# Altium schematic sheet Mux_Sheet_2.SchDoc
size A4; SheetNumber: 9
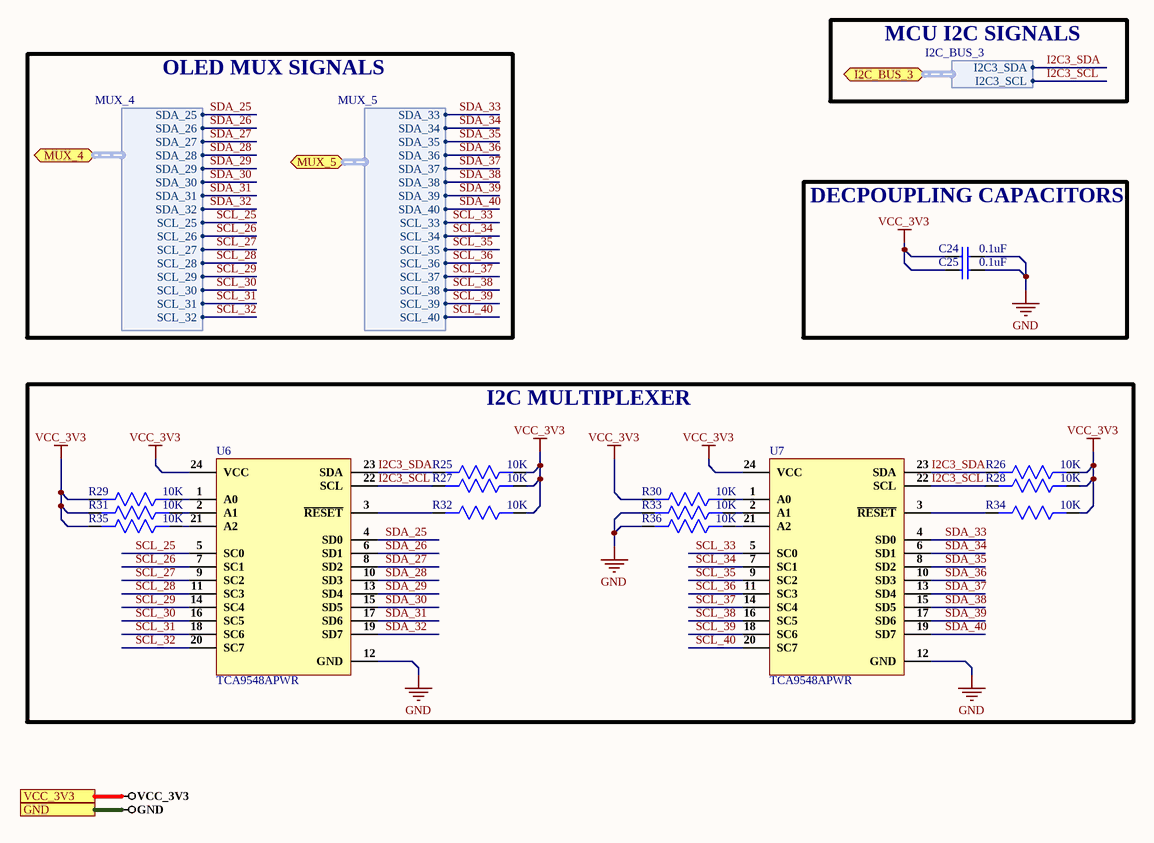
[diagram p0: Mux_Sheet_2.SchDoc]

## Parts
C24  0.1uF  [Cap0603]
C25  0.1uF  [Cap0603]
R25  10K  [Res0603]
R26  10K  [Res0603]
R27  10K  [Res0603]
R28  10K  [Res0603]
R29  10K  [Res0603]
R30  10K  [Res0603]
R31  10K  [Res0603]
R32  10K  [Res0603]
R33  10K  [Res0603]
R34  10K  [Res0603]
R35  10K  [Res0603]
R36  10K  [Res0603]
U6  TCA9548APWR  [24-TSSOP]
U7  TCA9548APWR  [24-TSSOP]

## Blocks framed on the sheet
DECPOUPLING CAPACITORS: C24 C25
I2C MULTIPLEXER: R25-R36 U6 U7

## Ports
GND, I2C_BUS_3 (bidir, harness I2C_BUS_3), MUX_4 (bidir, harness MUX_4), MUX_5 (bidir, harness MUX_5), VCC_3V3

## Harnesses
MUX_4: SDA_25, SDA_26, SDA_27, SDA_28, SDA_29, SDA_30, SDA_31, SDA_32, SCL_25, SCL_26, SCL_27, SCL_28, SCL_29, SCL_30, SCL_31, SCL_32
MUX_5: SDA_33, SDA_34, SDA_35, SDA_36, SDA_37, SDA_38, SDA_39, SDA_40, SCL_33, SCL_34, SCL_35, SCL_36, SCL_37, SCL_38, SCL_39, SCL_40
I2C_BUS_3: I2C3_SDA, I2C3_SCL

## Nets
GND: C24.2 C25.2 R33.2 R36.2 U6.12(GND) U7.12(GND) ; port GND
VCC_3V3: C24.1 C25.1 R25.1 R26.1 R27.1 R28.1 R29.2 R30.2 R31.2 R32.1 R34.1 R35.2 U6.24(VCC) U7.24(VCC) ; port VCC_3V3
I2C3_SCL: R27.2 R28.2 U6.22(SCL) U7.22(SCL) ; port I2C_BUS_3.I2C3_SCL
I2C3_SDA: R25.2 R26.2 U6.23(SDA) U7.23(SDA) ; port I2C_BUS_3.I2C3_SDA
SCL_25: U6.5(SC0) ; port MUX_4.SCL_25
SCL_26: U6.7(SC1) ; port MUX_4.SCL_26
SCL_27: U6.9(SC2) ; port MUX_4.SCL_27
SCL_28: U6.11(SC3) ; port MUX_4.SCL_28
SCL_29: U6.14(SC4) ; port MUX_4.SCL_29
SCL_30: U6.16(SC5) ; port MUX_4.SCL_30
SCL_31: U6.18(SC6) ; port MUX_4.SCL_31
SCL_32: U6.20(SC7) ; port MUX_4.SCL_32
SCL_33: U7.5(SC0) ; port MUX_5.SCL_33
SCL_34: U7.7(SC1) ; port MUX_5.SCL_34
SCL_35: U7.9(SC2) ; port MUX_5.SCL_35
SCL_36: U7.11(SC3) ; port MUX_5.SCL_36
SCL_37: U7.14(SC4) ; port MUX_5.SCL_37
SCL_38: U7.16(SC5) ; port MUX_5.SCL_38
SCL_39: U7.18(SC6) ; port MUX_5.SCL_39
SCL_40: U7.20(SC7) ; port MUX_5.SCL_40
SDA_25: U6.4(SD0) ; port MUX_4.SDA_25
SDA_26: U6.6(SD1) ; port MUX_4.SDA_26
SDA_27: U6.8(SD2) ; port MUX_4.SDA_27
SDA_28: U6.10(SD3) ; port MUX_4.SDA_28
SDA_29: U6.13(SD4) ; port MUX_4.SDA_29
SDA_30: U6.15(SD5) ; port MUX_4.SDA_30
SDA_31: U6.17(SD6) ; port MUX_4.SDA_31
SDA_32: U6.19(SD7) ; port MUX_4.SDA_32
SDA_33: U7.4(SD0) ; port MUX_5.SDA_33
SDA_34: U7.6(SD1) ; port MUX_5.SDA_34
SDA_35: U7.8(SD2) ; port MUX_5.SDA_35
SDA_36: U7.10(SD3) ; port MUX_5.SDA_36
SDA_37: U7.13(SD4) ; port MUX_5.SDA_37
SDA_38: U7.15(SD5) ; port MUX_5.SDA_38
SDA_39: U7.17(SD6) ; port MUX_5.SDA_39
SDA_40: U7.19(SD7) ; port MUX_5.SDA_40
NetR29_1: R29.1 U6.1(A0)
NetR30_1: R30.1 U7.1(A0)
NetR31_1: R31.1 U6.2(A1)
NetR32_2: R32.2 U6.3(~{RESET})
NetR33_1: R33.1 U7.2(A1)
NetR34_2: R34.2 U7.3(~{RESET})
NetR35_1: R35.1 U6.21(A2)
NetR36_1: R36.1 U7.21(A2)

## Notes on the sheet
- MCU I2C SIGNALS
- OLED MUX SIGNALS

## Library data of the parts
C24 C25 = CC0603ZRY5V9BB104: CAP CER 0.1UF 50V Y5V 0603; Manufacturer: Yageo; Capacitance: 100nF; Tolerance: 80%; Supplier 1: Digi-Key; Manufacturer Part Number: CC0603ZRY5V9BB104; Stock 1: 15000880; Pricing 1: 1=0.1, 10=0.075, 100=0.0334, 500=0.02386, 1000=0.01874 (USD); Mount: Surface Mount; Case/Package: 0603; Number of Pins: 2; Case Code (Metric): 1608; Case Code (Imperial): 0603; Min Operating Temperature: -30°C; Max Operating Temperature: 85°C; Dielectric: Y5V; Voltage Rating: 50V; Package Quantity: 1; Packaging: Tape and Reel; Voltage Rating (DC): 50V; Termination: SMD/SMT; Composition: Ceramic; Voltage: 50V; Length: 1.6mm; Height: 0.8mm; Width: 0.031inch; Thickness: 0.035inch; Depth: 0.8mm; Radiation Hardening: No; REACH SVHC: No SVHC; Lead Free: Lead Free; Halogen Free: Halogen Free; ComponentLink1URL: http://www.yageo.com/documents/recent/UPY-GPHC_Y5V_6.3V-to-50V_8.pdf?src-supplier=Digi-Key; ComponentLink1Description: http://www.yageo.com/documents/recent/UPY-GPHC_Y5V_6.3V-to-50V_8.pdf?src-supplier=Digi-Key; ComponentLink2URL: http://www.yageo.com/documents/recent/UPY-GPHC_Y5V_6.3V-to-50V_5.pdf?src-supplier=Avnet+Europe; ComponentLink2Description: http://www.yageo.com/documents/recent/UPY-GPHC_Y5V_6.3V-to-50V_5.pdf?src-supplier=Avnet+Europe; ComponentLink3URL: https://www.verical.com/server-webapp/html/getDatasheet?partID=403611&src-supplier=Verical; ComponentLink3Description: https://www.verical.com/server-webapp/html/getDatasheet?partID=403611&src-supplier=Verical; ComponentLink4URL: http://www.mouser.com/ds/2/447/Yageo_UPY-GP_NP0_16V-to-50V_9-358835.pdf?src-supplier=Mouser; ComponentLink4Description: http://www.mouser.com/ds/2/447/Yageo_UPY-GP_NP0_16V-to-50V_9-358835.pdf?src-supplier=Mouser; ComponentLink5URL: http://www.farnell.com/datasheets/1132289.pdf?src-supplier=Element14; ComponentLink5Description: http://www.farnell.com/datasheets/1132289.pdf?src-supplier=Element14; Supplier Part Number 1: 311-1343-1-ND
R25-R36 = AC0603JR-0710KL: RES SMD 10K OHM 5% 1/10W 0603; Manufacturer: Yageo; Voltage Rating: 50V; Resistance: 10kR; Power Rating: 100mW; Temperature Coefficient: 100ppm/°C; Supplier 1: Future Electronics; Manufacturer Part Number: AC0603JR-0710KL; RoHS: Yes; Category: Chip SMD Resistors; Stock 1: 1533000; Pricing 1: 5000=0.00540 (USD); Case/Package: 0603; Case Code (Imperial): 0603; Case Code (Metric): 1608; Size Code: 0603; Min Operating Temperature: -55°C; Max Operating Temperature: 155°C; Packaging: Tape and Reel; Tolerance: 5%; Package Quantity: 1; Resistor Type: Thick Film; Termination: SMD/SMT; Number of Terminations: 2; Max Power Dissipation: 100mW; Features: Moisture Resistant,Automotive AEC-Q200,Anti-Sulfur; Series: AC; Construction: Rectangular; Length: 0.063inch; Width: 0.031inch; Height: 0.022inch; Depth: 0.8mm; Military Standard: Not; Lead Free: Lead Free; RoHS Compliant: Yes; ComponentLink1URL: https://datasheet.ciiva.com/5562/pyu-ac-51-rohs-l-2-5562553.pdf?src-supplier=Mouser; ComponentLink1Description: https://datasheet.ciiva.com/5562/pyu-ac-51-rohs-l-2-5562553.pdf?src-supplier=Mouser; Supplier Part Number 1: 1029044
U6 U7 = TCA9548APWR: IC BUS SWITCH 1 X 8:1 24TSSOP; Manufacturer: Texas Instruments; Max Supply Voltage: 5.5V; Min Supply Voltage: 1.65V; On-State Resistance: 70R; Max Supply Current: 80uA; Supply Type: Single; Independent Circuits: 1; Supplier 1: Digi-Key; Manufacturer Part Number: TCA9548APWR; RoHS: Yes; Category: Decoders and Multiplexers; Pricing 1: 1=2.09000, 10=1.87600, 25=1.77040, 100=1.50820, 250=1.41616, 500=1.23914, 1000=1.16900 (USD); Mount: Surface Mount; Case/Package: TSSOP; Number of Pins: 24; Contact Plating: Gold; Min Operating Temperature: -40°C; Max Operating Temperature: 85°C; Packaging: Tape and Reel; Package Quantity: 1; REACH SVHC: No SVHC; Lead Free: Lead Free; ComponentLink1URL: https://datasheet.ciiva.com/6614/tca9548a-6614721.pdf?src-supplier=Digi-Key; ComponentLink1Description: https://datasheet.ciiva.com/6614/tca9548a-6614721.pdf?src-supplier=Digi-Key; Supplier Part Number 1: 296-34905-1-ND